# EasyEDA Pro project ProPrj_SensUs2026_ParisBioTek_PCBs.epro, schematic Schematic3
Board Name: NRF board; Create Date: 2026-04-29; Page Name: P1; Project Name: PBT_PCB; Schematic Name: Schematic3; Update Date: 2026-06-25; Company: EasyEDA.com; Page Size: A4; Version: V1.0
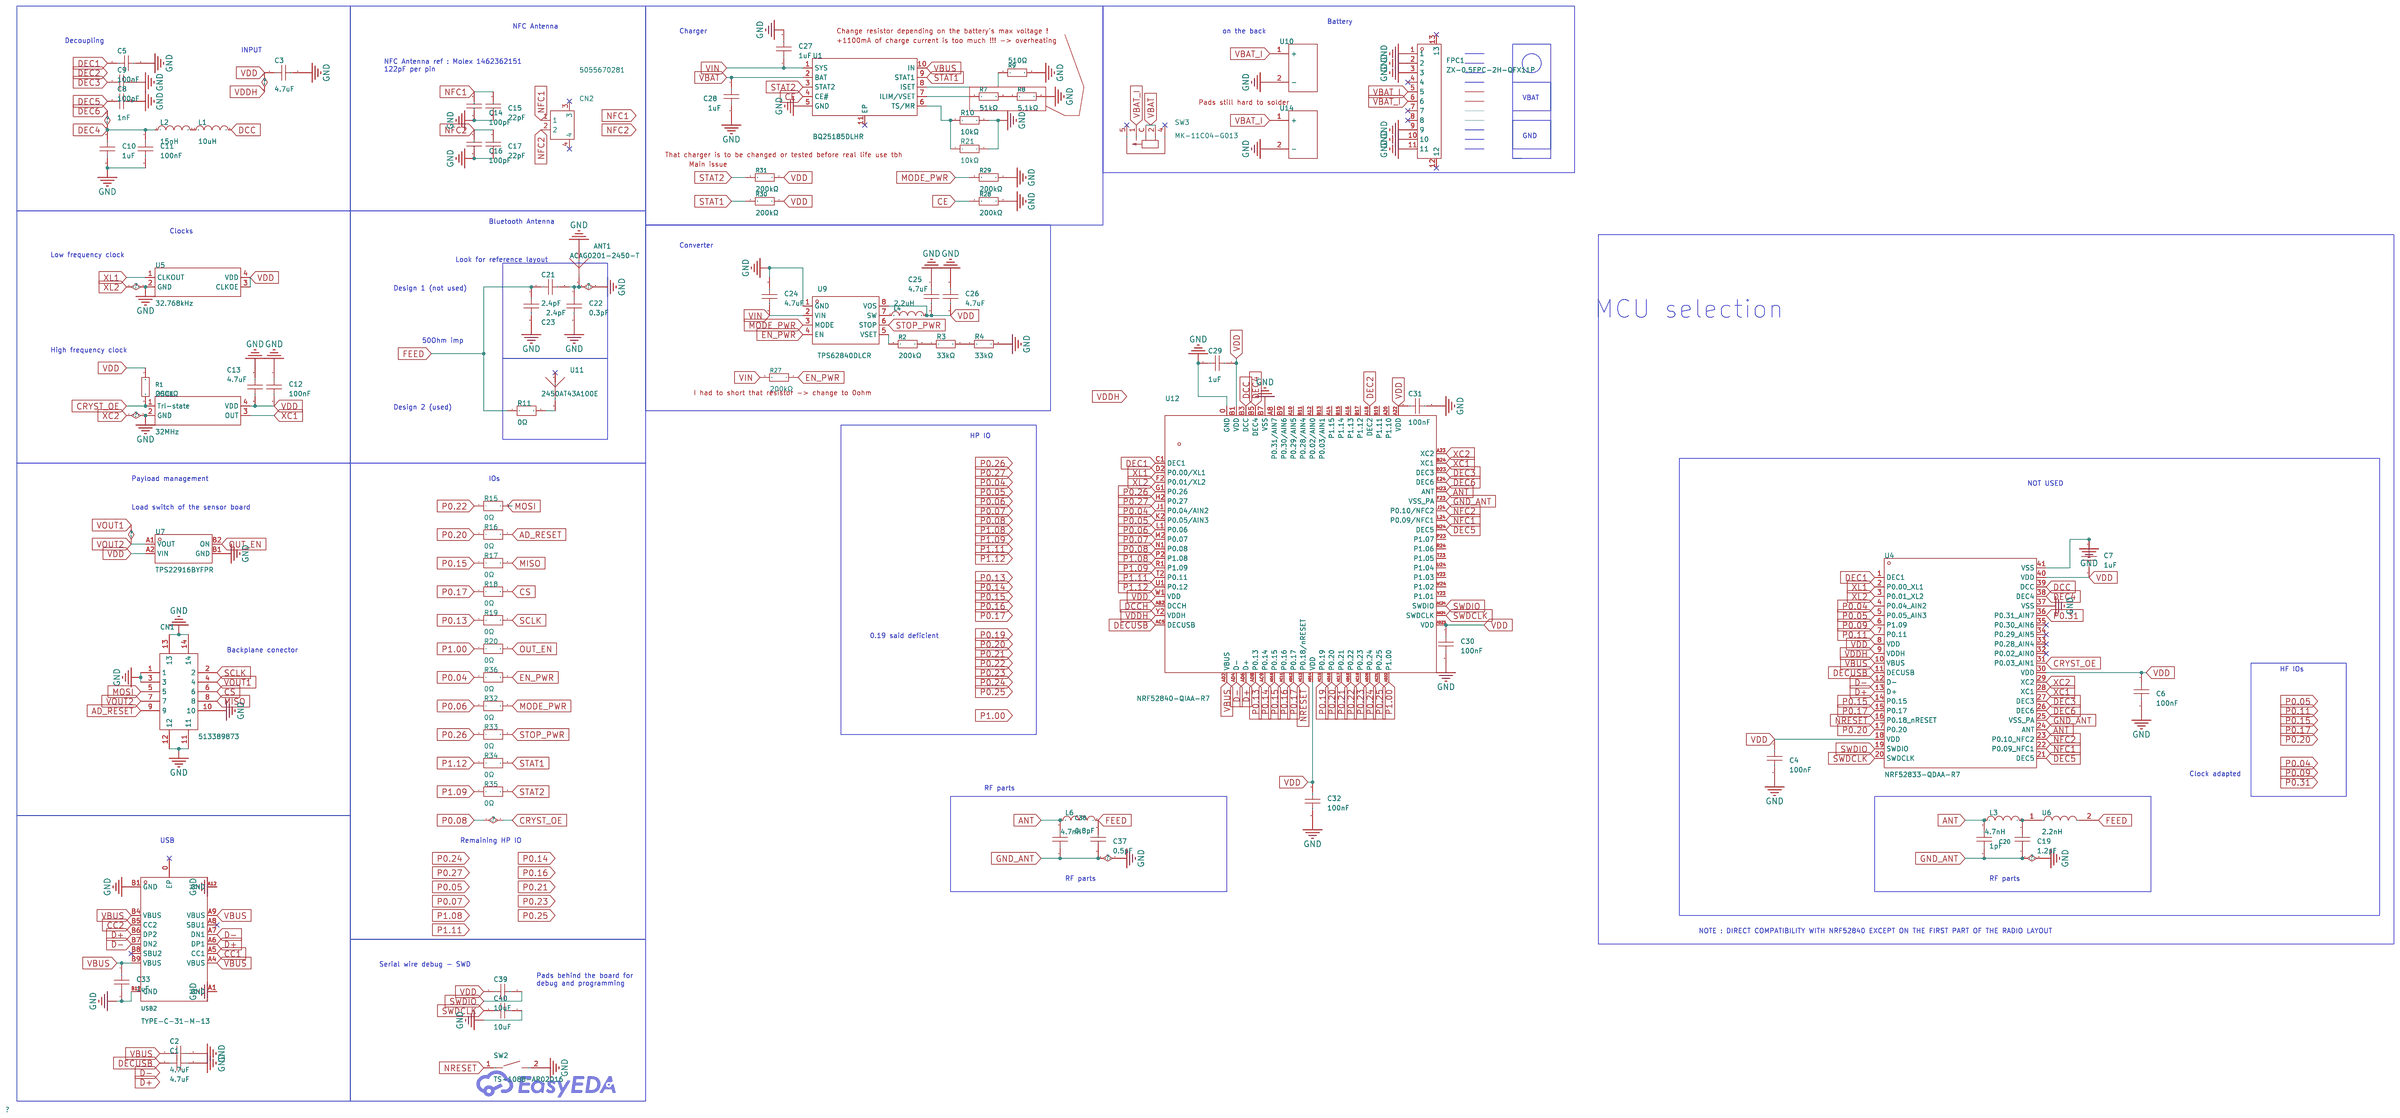
[diagram p1: schematic sheet]

## Parts
ANT1  ACAG0201-2450-T  [ANT-SMD_L2.0-W1.3_ACAG0201-2450-T]
C1  4.7uF  [C0402]
C2  4.7uF  [C0402]
C3  4.7uF  [C0402]
C4  100nF  [C0402]  (no BOM)
C5  100nF  [C0402]
C6  100nF  [C0402]  (no BOM)
C7  1uF  [C0402]  (no BOM)
C8  1nF  [C0402]
C9  100pF  [C0402]
C10  1uF  [C0402]
C11  100nF  [C0402]
C12  100nF  [C0402]
C13  4.7uF  [C0402]
C14  100pF  [C0402]
C15  22pF  [C0402]
C16  100pF  [C0402]
C17  22pF  [C0402]
C19  1.2pF  [C0402]  (no BOM)
C20  1pF  [C0402]  (no BOM)
C21  2.4pF  [C0402]
C22  0.3pF  [C0603]
C23  2.4pF  [C0402]  (no BOM)
C24  4.7uF  [C0402]
C25  4.7uF  [C0402]
C26  4.7uF  [C0402]
C27  1uF  [C0402]
C28  1uF  [C0402]
C29  1uF  [C0402]
C30  100nF  [C0402]
C31  100nF  [C0402]
C32  100nF  [C0402]
C33  1uF  [C0402]
C37  0.5pF  [C0402]
C38  0.8pF  [C0402]
C39  10uF  [C0805]  (no BOM)
C40  10uF  [C0805]  (no BOM)
CN1  513389873  [CONN-SMD_513389873]
CN2  5055670281  [CONN-SMD_2P-P1.25_MOLEX_5055670281]  (no BOM)
FPC1  ZX-0.5FPC-2H-QFX11P  [FPC-SMD_11P-P0.50_ZX-0.5FPC-2H-QFX11P]  (no BOM)
L1  10uH  [L0603]
L2  15nH  [IND-SMD_L1.2-W0.6]
L3  4.7nH  [L0402]  (no BOM)
L4  2.2uH  [IND-SMD_L2.0-W1.6_MHCHL201610A-1R0M-Q8A]
L6  4.7nH  [L0402]
OSC1  32MHz  [OSC-SMD_4P-L3.2-W2.5-BL]
R1  200kΩ  [R0402]
R2  200kΩ  [R0402]
R3  33kΩ  [R0402]
R4  33kΩ  [R0402]
R7  51kΩ  [R0402]
R8  5.1kΩ  [R0402]
R9  510Ω  [R0402]
R10  10kΩ  [R0402]
R11  0Ω  [R0402]
R15  0Ω  [R0402]
R16  0Ω  [R0402]
R17  0Ω  [R0402]
R18  0Ω  [R0402]
R19  0Ω  [R0402]
R20  0Ω  [R0402]
R21  10kΩ  [R0402]  (no BOM)
R27  200kΩ  [R0402]
R28  200kΩ  [R0402]
R29  200kΩ  [R0402]
R30  200kΩ  [R0402]
R31  200kΩ  [R0402]
R32  0Ω  [R0402]
R33  0Ω  [R0402]
R34  0Ω  [R0402]
R35  0Ω  [R0402]
R36  0Ω  [R0402]
SW2  TS-1088-AR02016  [SW-SMD_L3.9-W3.0-P4.45]
SW3  MK-11C04-G013  [SW-SMD_MK-11C04-G013]
U1  BQ25185DLHR  [WSON-10_L2.2-W2.0-P0.40-BL-EP_TI_DLH0010A]
U4  NRF52833-QDAA-R7  [QFN-40_L5.0-W5.0-P0.40-TL-EP3.6]  (no BOM)
U5  32.768kHz  [OSC-SMD_4P-L3.2-W1.5-BL]
U6  2.2nH  [L0402]  (no BOM)
U7  TPS22916BYFPR  [DSBGA-4_L0.8-W0.8-R2-C2-P0.40-BL]
U9  TPS62840DLCR  [VSON-8_L2.0-W1.5-P0.50-BL]
U10  -  [CSSMR950SH_CONN]
U11  2450AT43A100E  [ANT-SMD_L7.0-W2.0-R]
U12  NRF52840-QIAA-R7  [AQFN-73_L7.0-W7.0-P0.50-BL-EP4.8]
U14  -  [CSSMR950SH_CONN]
USB2  TYPE-C-31-M-13  [USB-C-SMD_TYPE-C-31-M-13]

## Library data of the parts
ANT1 = ACAG0201-2450-T: Antenna Type:Ceramic Antenna Frequency(Center/Band):2.4GHz Bandwidth:65MHz Peak Gain:2.7dBi Peak Gain:2.7dBi Impedance:50Ω VSWR:2 Operating Temperature:-40℃~+125℃ Operating Temperature:-40℃~+125℃ Length:2mm Width:1.25mm Height:0.6mm; LCSC Part Name: 低剖面紧凑型2.4 GHz陶瓷片式天线; Supplier Part: C3284598; Manufacturer: ABRACON; Supplier Footprint: 0805; Datasheet: https://item.szlcsc.com/datasheet/ACAG0201-2450-T/3847497.html; Supplier: LCSC; Antenna Type: Ceramic Antenna; Frequency(Center/Band): 2.4GHz; Bandwidth: 65MHz; Peak Gain: 2.7dBi; Impedance: 50Ω; VSWR: 2; Operating Temperature: -40℃~+125℃; Length: 2mm; Width: 1.25mm; Height: 0.6mm
C1-C3 C13 C24-C26 = CL05A475MP5NRNC: Capacitance:4.7uF Tolerance:±20% Tolerance:±20% Voltage Rating:10V Temperature Coefficient:X5R; LCSC Part Name: 4.7uF ±20% 10V; Supplier Part: C23733; Manufacturer: SAMSUNG(三星); Supplier Footprint: 0402; JLCPCB Part Class: Basic Part; Datasheet: https://item.szlcsc.com/datasheet/CL05A475MP5NRNC/24469.html; Supplier: LCSC; Tolerance: ±20%; Voltage Rating: 10V; Temperature Coefficient: X5R
C4-C6 C11 C12 C30-C32 = CL05B104KO5NNNC: Capacitance:100nF Tolerance:±10% Tolerance:±10% Voltage Rating:16V Temperature Coefficient:X7R; LCSC Part Name: 100nF ±10% 16V; Supplier Part: C1525; Manufacturer: SAMSUNG(三星); Supplier Footprint: 0402; JLCPCB Part Class: Basic Part; Datasheet: https://item.szlcsc.com/datasheet/CL05B104KO5NNNC/1877.html; Supplier: LCSC; Tolerance: ±10%; Voltage Rating: 16V; Temperature Coefficient: X7R
C7 C10 C27-C29 C33 = CL05A105KA5NQNC: Capacitance:1uF Tolerance:±10% Tolerance:±10% Voltage Rating:25V Temperature Coefficient:X5R; LCSC Part Name: 1uF ±10% 25V; Supplier Part: C52923; Manufacturer: SAMSUNG(三星); Supplier Footprint: 0402; JLCPCB Part Class: Basic Part; Datasheet: https://item.szlcsc.com/datasheet/CL05A105KA5NQNC/53938.html; Supplier: LCSC; Tolerance: ±10%; Voltage Rating: 25V; Temperature Coefficient: X5R
C8 = 0402B102K500NT: Capacitance:1nF Tolerance:±10% Tolerance:±10% Voltage Rating:50V Temperature Coefficient:X7R; LCSC Part Name: 1nF ±10% 50V; Supplier Part: C1523; Manufacturer: FH(风华); Supplier Footprint: 0402; Datasheet: https://item.szlcsc.com/datasheet/0402B102K500NT/1875.html; Supplier: LCSC; Tolerance: ±10%; Voltage Rating: 50V; Temperature Coefficient: X7R
C9 C14 C16 = 0402CG101J500NT: Capacitance: Tolerance:±5% Tolerance:±5% Voltage Rated: Temperature Coefficient:; LCSC Part Name: 100pF ±5% 50V; Supplier Part: C1546; Manufacturer: FH(风华); Supplier Footprint: 0402; JLCPCB Part Class: Basic Part; Datasheet: https://atta.szlcsc.com/upload/public/pdf/source/20200305/C486355_26A10D38EF8C2A5C37091D0039909270.pdf; Supplier: LCSC; Tolerance: ±5%
C15 C17 = 0402CG220J500NT: Capacitance:22pF Tolerance:±5% Tolerance:±5% Voltage Rating:50V Temperature Coefficient:C0G; LCSC Part Name: 22pF ±5% 50V; Supplier Part: C1555; Manufacturer: FH(风华); Supplier Footprint: 0402; Datasheet: https://item.szlcsc.com/datasheet/0402CG220J500NT/1907.html; Supplier: LCSC; Tolerance: ±5%; Voltage Rating: 50V; Temperature Coefficient: C0G
C19 = RF15N1R2A500CT: Capacitance: Voltage Rated: Temperature Coefficient:; LCSC Part Name: 1.2pF 50V; Supplier Part: C172868; Manufacturer: Walsin(华新科); Supplier Footprint: 0402; Datasheet: https://atta.szlcsc.com/upload/public/pdf/source/20191217/C469622_E5C675410661E206E30F3A5ADE7C582C.pdf; Supplier: LCSC
C20 = RF15N1R0A500CT: Capacitance:1pF Voltage Rating:50V Temperature Coefficient:NP0; LCSC Part Name: ±0.05pF 1pF 50V; Supplier Part: C172848; Manufacturer: Walsin(华新科); Supplier Footprint: 0402; Datasheet: https://item.szlcsc.com/datasheet/RF15N1R0A500CT/184237.html; Supplier: LCSC; Voltage Rating: 50V; Temperature Coefficient: NP0
C21 C23 = RF15N2R4A500CT: Capacitance: Voltage Rated: Temperature Coefficient:; LCSC Part Name: 2.4pF 50V ±0.05pF; Supplier Part: C396878; Manufacturer: Walsin(华新科); Supplier Footprint: 0402; JLCPCB Part Class: Extended Part; Datasheet: https://atta.szlcsc.com/upload/public/pdf/source/20191217/C469622_E5C675410661E206E30F3A5ADE7C582C.pdf; Supplier: LCSC
C22 = CQ0603ARNPO0BNR30: Capacitance:0.3pF Voltage Rating:100V Temperature Coefficient:NP0; LCSC Part Name: ±0.05pF 0.3pF 100V; Supplier Part: C386172; Manufacturer: YAGEO(国巨); Supplier Footprint: 0603; Datasheet: https://item.szlcsc.com/datasheet/CQ0603ARNPO0BNR30/360151.html; Supplier: LCSC; Voltage Rating: 100V; Temperature Coefficient: NP0
C37 = RF15N0R5A500CT: Capacitance: Voltage Rated: Temperature Coefficient:; LCSC Part Name: 0.5pF 50V ±0.05pF; Supplier Part: C172855; Manufacturer: Walsin(华新科); Supplier Footprint: 0402; Datasheet: https://atta.szlcsc.com/upload/public/pdf/source/20191217/C469622_E5C675410661E206E30F3A5ADE7C582C.pdf; Supplier: LCSC
C38 = RF15N0R8B500CT_C396870: Capacitance:0.8pF Voltage Rating:50V Temperature Coefficient:NP0; LCSC Part Name: ±0.1pF 0.8pF 50V; Supplier Part: C396870; Manufacturer: Walsin(华新科); Manufacturer Part: RF15N0R8B500CT; Supplier Footprint: 0402; Datasheet: https://item.szlcsc.com/datasheet/RF15N0R8B500CT/378314.html; Supplier: LCSC; Voltage Rating: 50V; Temperature Coefficient: NP0
C39 C40 = CL21A106KAYNNNE_C15850: Capacitance:10uF Tolerance:±10% Tolerance:±10% Voltage Rating:25V Temperature Coefficient:X5R; LCSC Part Name: 10uF ±10% 25V; Supplier Part: C15850; Manufacturer: SAMSUNG(三星); Manufacturer Part: CL21A106KAYNNNE; Supplier Footprint: 0805; Datasheet: https://item.szlcsc.com/datasheet/CL21A106KAYNNNE/16532.html; Supplier: LCSC; Tolerance: ±10%; Voltage Rating: 25V; Temperature Coefficient: X5R
CN1 = 513389873: Number of Pins:10P Pitch:0.4mm Mounting Type:Surface Mount,Vertical Number of Rows:2 Current Rating:300mA Voltage Rating:50V System Fit Height:2mm；1.5mm Contact Material:Phosphor Bronze Contact Plating:Gold Operating Temperature:-40℃~+105℃ Operating Tempe; LCSC Part Name: PIN:10P 间距:0.4mm 立贴; Supplier Part: C122427; Manufacturer: MOLEX; Supplier Footprint: SMD,P=0.4mm; JLCPCB Part Class: Extended Part; Datasheet: https://www.molex.com/content/dam/molex/molex-dot-com/products/automated/en-us/salesdrawingpdf/513/51338/513389873_sd.pdf?inline; Supplier: LCSC; Number of Pins: 10P; Pitch: 0.4mm; Mounting Type: Surface Mount,Vertical; Number of Rows: 2; Current Rating: 300mA; Voltage Rating: 50V; System Fit Height: 2mm；1.5mm; Contact Material: Phosphor Bronze; Contact Plating: Gold; Operating Temperature: -40℃~+105℃
CN2 = 5055670281: Pins Structure:1x2P Pitch:1.25mm Mounting Type:Surface Mount, Right Angle Number of Pins:2P Number of Rows:1 Number of PINs Per Row:2 Current Rating:1.5A Contact Material:Brass Contact Plating:Gold Operating Temperature:-40℃~+105℃ Operating Temperature:-4; LCSC Part Name: 1x2P 间距:1.25mm 卧贴; Supplier Part: C17256596; Manufacturer: MOLEX; Supplier Footprint: SMD,P=1.25mm; JLCPCB Part Class: Extended Part; Datasheet: https://www.molex.com/content/dam/molex/molex-dot-com/products/automated/en-us/salesdrawingpdf/505/505567/5055670281_sd.pdf?inline\; Supplier: LCSC; Pins Structure: 1x2P; Pitch: 1.25mm; Mounting Type: Surface Mount, Right Angle; Number of Pins: 2P; Number of Rows: 1; Number of PINs Per Row: 2; Current Rating: 1.5A; Contact Material: Brass; Contact Plating: Gold; Operating Temperature: -40℃~+105℃; Voltage Rating: 50V; Flame Retardant Rating: UL94V-0; Color: Black
FPC1 = ZX-0.5FPC-2H-QFX11P: Locking Feature:Hinged Lid Contact Type:Bottom Contact Number of Contacts:11P Pitch:0.5mm Mounting Type:Surface Mount, Right Angle FFC, FCB Thickness:0.3mm FFC, FCB Thickness:0.3mm Height Above Board:2mm Contact Material:Copper Alloy Contact Plating:Tin O; LCSC Part Name: 翻盖式 下接 P数:11P 间距:0.5mm; Supplier Part: C19191100; Manufacturer: Megastar(兆星); Supplier Footprint: SMD,P=0.5mm,卧贴; JLCPCB Part Class: Extended Part; Datasheet: https://item.szlcsc.com/datasheet/ZX-0.5FPC-2H-QFX11P/20428955.html; Supplier: LCSC; Locking Feature: Hinged Lid; Contact Type: Bottom Contact; Number of Contacts: 11P; Pitch: 0.5mm; Mounting Type: Surface Mount, Right Angle; FFC, FCB Thickness: 0.3mm; Height Above Board: 2mm; Contact Material: Copper Alloy; Contact Plating: Tin; Operating Temperature: -25℃~+85℃; Rated Voltage (Max): 50V
L1 = LQM18DN100M70L: Inductance: Tolerance:±20% Tolerance:±20% Rated Current:- Saturation Current (Isat): DC Resistance (DCR): Q @ Freq:- Frequency - Self Resonant:32MHz Ratings:; LCSC Part Name: 10uH ±20% 100mA; Supplier Part: C713281; Manufacturer: muRata(村田); Supplier Footprint: 0603; Datasheet: https://atta.szlcsc.com/upload/public/pdf/source/20210429/AB22F7ABB535E8E7DFFF970785F8131A.pdf; Supplier: LCSC; Tolerance: ±20%; Frequency - Self Resonant: 32MHz
L2 = AISC-0402-15NJ-T: Inductance:15nH Tolerance:±5% Tolerance:±5% Current Rating:560mA Current - Saturation (Isat):- DC Resistance(DCR):- Q @ Frequency:26@250MHz Frequency - Self Resonant:3.28GHz; LCSC Part Name: 15nH ±5%; Supplier Part: C186832; Manufacturer: ABRACON; Supplier Footprint: 0402; Datasheet: https://item.szlcsc.com/datasheet/AISC-0402-15NJ-T/198237.html; Supplier: LCSC; Tolerance: ±5%; Current Rating: 560mA; Q @ Frequency: 26@250MHz; Frequency - Self Resonant: 3.28GHz
L3 L6 = VHF100505HQ4N7ST: Inductance:4.7nH Current Rating:300mA Current - Saturation (Isat):- DC Resistance(DCR):200mΩ Q @ Frequency:- Frequency - Self Resonant:- Ratings:-; LCSC Part Name: ±0.3nH 4.7nH; Supplier Part: C395070; Manufacturer: FH(风华); Supplier Footprint: 0402; Datasheet: https://item.szlcsc.com/datasheet/VHF100505HQ4N7ST/375486.html; Supplier: LCSC; Current Rating: 300mA; DC Resistance(DCR): 200mΩ
L4 = WIP201610P-2R2ML: Inductance: Tolerance:±20% Tolerance:±20% Rated Current: Saturation Current (Isat):- DC Resistance (DCR): Q @ Freq:- Frequency - Self Resonant:- Ratings:; LCSC Part Name: 2.2uH ±20%; Supplier Part: C315717; Manufacturer: INPAQ(佳邦); Supplier Footprint: 0806; Datasheet: https://atta.szlcsc.com/upload/public/pdf/source/20181022/C315716_08E9DB17D82CB1F96C1ECEC7E5AE09CA.pdf; Supplier: LCSC; Tolerance: ±20%
OSC1 = OT2EL89CJI-111YLC-32M: Frequency:32MHz Normal temperature Frequency Tolerance:±10ppm Normal temperature Frequency Tolerance:±10ppm Output Type:CMOS Voltage - Supply:1.8V~3.3V Voltage - Supply:1.8V~3.3V Frequency Stability:±20ppm Frequency Stability:±20ppm Operating Temperature:; LCSC Part Name: YSO110TR 32MHZ 1.8V-3.3V ±10PPM -40~85℃（±20PPM) CMOS; Supplier Part: C7434927; Manufacturer: YXC(扬兴晶振); Supplier Footprint: SMD3225-4P; Datasheet: https://item.szlcsc.com/datasheet/OT2EL89CJI-111YLC-32M/8448260.html; Supplier: LCSC; Normal temperature Frequency Tolerance: ±10ppm; Output Type: CMOS; Voltage - Supply: 1.8V~3.3V; Frequency Stability: ±20ppm; Operating Temperature: -40℃~+85℃
R1 R2 R27-R31 = 0402WGF2003TCE: Type:Thick Film Resistor Resistance:200kΩ Tolerance:±1% Tolerance:±1% Power(Watts):62.5mW Voltage-Supply(Max):50V Temperature Coefficient:±100ppm/℃ Temperature Coefficient:±100ppm/℃ Operating Temperature:-55℃~+155℃ Operating Temperature:-55℃~+155℃; LCSC Part Name: 200kΩ ±1% 62.5mW 厚膜电阻; Supplier Part: C25764; Manufacturer: UNI-ROYAL(厚声); Supplier Footprint: 0402; Datasheet: https://item.szlcsc.com/datasheet/0402WGF2003TCE/26507.html; Supplier: LCSC; Type: Thick Film Resistor; Tolerance: ±1%; Power(Watts): 62.5mW; Voltage-Supply(Max): 50V; Temperature Coefficient: ±100ppm/℃; Operating Temperature: -55℃~+155℃
R3 R4 = 0402WGF3302TCE: Type:Thick Film Resistors Resistance:33kΩ Tolerance:±1% Tolerance:±1% Power(Watts): Overload Voltage (Max): Temperature Coefficient:±100ppm/℃ Temperature Coefficient:±100ppm/℃ Operating Temperature Range:-55℃~+155℃ Operating Temperature Range:-55℃~+155℃; LCSC Part Name: 33kΩ ±1% 62.5mW 厚膜电阻; Supplier Part: C25779; Manufacturer: UNI-ROYAL(厚声); Supplier Footprint: 0402; JLCPCB Part Class: Basic Part; Datasheet: https://atta.szlcsc.com/upload/public/pdf/source/20200306/C422600_1E6D84923E4A46A82E41ADD87F860B5C.pdf; Supplier: LCSC; Type: Thick Film Resistors; Tolerance: ±1%; Temperature Coefficient: ±100ppm/℃; Operating Temperature Range: -55℃~+155℃
R7 = 0402WGF5102TCE: Type:Thick Film Resistors Resistance:51kΩ Tolerance:±1% Tolerance:±1% Power(Watts): Overload Voltage (Max): Temperature Coefficient:±100ppm/℃ Temperature Coefficient:±100ppm/℃ Operating Temperature Range:-55℃~+155℃ Operating Temperature Range:-55℃~+155℃; LCSC Part Name: 51kΩ ±1% 62.5mW 厚膜电阻; Supplier Part: C25794; Manufacturer: UNI-ROYAL(厚声); Supplier Footprint: 0402; Datasheet: https://atta.szlcsc.com/upload/public/pdf/source/20200306/C422600_1E6D84923E4A46A82E41ADD87F860B5C.pdf; Supplier: LCSC; Type: Thick Film Resistors; Tolerance: ±1%; Temperature Coefficient: ±100ppm/℃; Operating Temperature Range: -55℃~+155℃
R8 = 0402WGF5101TCE: Type:Thick Film Resistor Resistance:5.1kΩ Tolerance:±1% Tolerance:±1% Power(Watts):62.5mW Voltage-Supply(Max):50V Temperature Coefficient:±100ppm/℃ Temperature Coefficient:±100ppm/℃ Operating Temperature:-55℃~+155℃ Operating Temperature:-55℃~+155℃; LCSC Part Name: 5.1kΩ ±1% 62.5mW 厚膜电阻; Supplier Part: C25905; Manufacturer: UNI-ROYAL(厚声); Supplier Footprint: 0402; Datasheet: https://item.szlcsc.com/datasheet/0402WGF5101TCE/26648.html; Supplier: LCSC; Type: Thick Film Resistor; Tolerance: ±1%; Power(Watts): 62.5mW; Voltage-Supply(Max): 50V; Temperature Coefficient: ±100ppm/℃; Operating Temperature: -55℃~+155℃
R9 = 0402WGF5100TCE: Type:Thick Film Resistor Resistance:510Ω Tolerance:±1% Tolerance:±1% Power(Watts):62.5mW Voltage-Supply(Max):50V Temperature Coefficient:±100ppm/℃ Temperature Coefficient:±100ppm/℃ Operating Temperature:-55℃~+155℃ Operating Temperature:-55℃~+155℃; LCSC Part Name: 510Ω ±1% 62.5mW 厚膜电阻; Supplier Part: C25123; Manufacturer: UNI-ROYAL(厚声); Supplier Footprint: 0402; Datasheet: https://item.szlcsc.com/datasheet/0402WGF5100TCE/25866.html; Supplier: LCSC; Type: Thick Film Resistor; Tolerance: ±1%; Power(Watts): 62.5mW; Voltage-Supply(Max): 50V; Temperature Coefficient: ±100ppm/℃; Operating Temperature: -55℃~+155℃
R10 R21 = 0402WGF1002TCE: Type:Thick Film Resistor Resistance:10kΩ Tolerance:±1% Tolerance:±1% Power(Watts):62.5mW Voltage-Supply(Max):50V Temperature Coefficient:±100ppm/℃ Temperature Coefficient:±100ppm/℃ Operating Temperature:-55℃~+155℃ Operating Temperature:-55℃~+155℃; LCSC Part Name: 10kΩ ±1% 62.5mW 厚膜电阻; Supplier Part: C25744; Manufacturer: UNI-ROYAL(厚声); Supplier Footprint: 0402; JLCPCB Part Class: Basic Part; Datasheet: https://item.szlcsc.com/datasheet/0402WGF1002TCE/26487.html; Supplier: LCSC; Type: Thick Film Resistor; Tolerance: ±1%; Power(Watts): 62.5mW; Voltage-Supply(Max): 50V; Temperature Coefficient: ±100ppm/℃; Operating Temperature: -55℃~+155℃
R11 R15-R20 R32-R36 = CRCW04020000Z0EDHP: Type:Thick Film Resistor Resistance:0Ω Power(Watts):200mW Voltage-Supply(Max):50V Operating Temperature:-55℃~+155℃ Operating Temperature:-55℃~+155℃; LCSC Part Name: 厚膜电阻 0Ω; Supplier Part: C844711; Manufacturer: VISHAY(威世); Supplier Footprint: 0402; Datasheet: https://item.szlcsc.com/datasheet/CRCW04020000Z0EDHP/904285.html; Supplier: LCSC; Type: Thick Film Resistor; Power(Watts): 200mW; Voltage-Supply(Max): 50V; Operating Temperature: -55℃~+155℃
SW2 = TS-1088-AR02016: Circuit:SPST Actuator Style:Round Button Operating Force:1.6N Mounting Type:Surface Mount,Vertical Length:4mm Width:3mm Switch Height:2mm with Bracket:Without Bracket Contact Current:50mA Voltage Rating:12V Actuator/Cap Color:Black Termination Style:SMD(S; LCSC Part Name: 4*3*2mm 立贴 轻触开关; Supplier Part: C720477; Manufacturer: XUNPU(讯普); Supplier Footprint: SMD,4x3mm; JLCPCB Part Class: Basic Part; Datasheet: https://item.szlcsc.com/datasheet/TS-1088-AR02016/763484.html; Supplier: LCSC; Circuit: SPST; Actuator Style: Round Button; Operating Force: 1.6N; Mounting Type: Surface Mount,Vertical; Length: 4mm; Width: 3mm; Switch Height: 2mm; with Bracket: Without Bracket; Contact Current: 50mA; Voltage Rating: 12V; Actuator/Cap Color: Black; Termination Style: SMD(SMT) Tab; Life: 100,000 Cycles; Operating Temperature: -30℃~+80℃
SW3 = MK-11C04-G013: Circuit:SPDT Actuator Style:Rectangular Columnar Termination Style:J-Lead Length:5.5mm Width:0.7mm Switch Height:3.8mm Mounting Type:Surface Mount, Right Angle Actuator Color:Black Current Rating:1A Voltage Rating:6V Life:10,000 Cycles Operating Temperatu; LCSC Part Name: 1P2T超小型拨动开关; Supplier Part: C778185; Manufacturer: G-Switch(品赞); Supplier Footprint: SMD,5.5x0.7mm; JLCPCB Part Class: Extended Part; Datasheet: https://item.szlcsc.com/datasheet/MK-11C04-G013/826786.html; Supplier: LCSC; Circuit: SPDT; Actuator Style: Rectangular Columnar; Termination Style: J-Lead; Length: 5.5mm; Width: 0.7mm; Switch Height: 3.8mm; Mounting Type: Surface Mount, Right Angle; Actuator Color: Black; Current Rating: 1A; Voltage Rating: 6V; Life: 10,000 Cycles; Operating Temperature: -20℃~+70℃
U1 = BQ25185DLHR: The Chip Type:Charging IC Voltage - Supply:3V~18V Voltage - Supply:3V~18V Charge Current - Max:1A Charging Saturation Voltage:4.4V End-Off Voltage:2.2V Type of Battery:Lithium Battery；LiFePO4 Battery Number of Cells:1 Number of Cells:1 Operating Temperatu; LCSC Part Name: 单节1A独立线性电池充电器，具备电源路径、工厂模式和电池跟踪功能; Supplier Part: C19725033; Manufacturer: TI(德州仪器); Supplier Footprint: WSON-10-EP(2.2x2); JLCPCB Part Class: Extended Part; Datasheet: https://www.ti.com.cn/cn/lit/ds/symlink/bq25185.pdf?ts=1739415017761&ref_url=https%253A%252F%252Fwww.ti.com.cn%252Fproduct%252Fcn%252FBQ25185%253FkeyMatch%253Dbq25185%2526tisearch%253Duniversal_search; Supplier: LCSC; The Chip Type: Charging IC; Voltage - Supply: 3V~18V; Charge Current - Max: 1A; Charging Saturation Voltage: 4.4V; End-Off Voltage: 2.2V; Type of Battery: Lithium Battery；LiFePO4 Battery; Number of Cells: 1; Operating Temperature: -40℃~+125℃; Battery Temperature Detection: Support; Supply Current (Iq): 4uA
U4 = NRF52833-QDAA-R7: Frequency Range:2.4GHz~2.4835GHz Frequency Range:2.4GHz~2.4835GHz Interface:ADC；PWM；I2S；UART；USB；SPI Voltage - Supply:1.7V~5.5V Voltage - Supply:1.7V~5.5V Applications:Bluetooth；ISM；IoT Output Power:8dBm Data Rate:2Mbps Current Of Transmitting:- Sensitivi; Supplier Part: C3007767; Manufacturer: NORDIC; Supplier Footprint: QFN-40-EP(5x5); Datasheet: https://item.szlcsc.com/datasheet/NRF52833-QDAA-R7/3496813.html; Supplier: LCSC; Frequency Range: 2.4GHz~2.4835GHz; Interface: ADC；PWM；I2S；UART；USB；SPI; Voltage - Supply: 1.7V~5.5V; Applications: Bluetooth；ISM；IoT; Output Power: 8dBm; Data Rate: 2Mbps; Typical Application Frequency: 2.4GHz; Operating Temperature: -40℃~+105℃
U5 = OV-7604-C7-32.768kHz-20PPM-TA-QC: Frequency:32.768kHz Normal temperature Frequency Tolerance:±20ppm Normal temperature Frequency Tolerance:±20ppm Operating Temperature:-40℃~+85℃ Operating Temperature:-40℃~+85℃; LCSC Part Name: 32.768kHz ±20ppm; Supplier Part: C5337982; Manufacturer: Micro Crystal(瑞士微晶); Supplier Footprint: SMD3215-4P; JLCPCB Part Class: Extended Part; Datasheet: https://www.microcrystal.com/fileadmin/Media/Products/kHzOSC/Datasheet/OV-7604-C7.pdf; Supplier: LCSC; Normal temperature Frequency Tolerance: ±20ppm; Operating Temperature: -40℃~+85℃
U6 = VHF100505HQ2N2BT: Inductance:; Supplier Part: C3032804; Manufacturer: FH(风华); Supplier Footprint: 0402; JLCPCB Part Class: Extended Part; Datasheet: https://atta.szlcsc.com/upload/public/pdf/source/20230208/097A5FD33363C9318A1C8B9447979AC6.pdf; Supplier: LCSC
U7 = TPS22916BYFPR: Type:Load Switch Number of Channels:1 Control Input Logic:Active High Voltage - Supply:1V~5.5V Voltage - Supply:1V~5.5V RDS(on):60mΩ Operating Temperature-:-40℃~+85℃ Operating Temperature-:-40℃~+85℃; LCSC Part Name: 1V至5.5V、2A、60mΩ超低泄漏负载开关; Supplier Part: C2150095; Manufacturer: TI(德州仪器); Supplier Footprint: DSBGA-4(0.7x0.7); Datasheet: https://www.ti.com/cn/lit/gpn/tps22916; Supplier: LCSC; Type: Load Switch; Number of Channels: 1; Control Input Logic: Active High; Voltage - Supply: 1V~5.5V; RDS(on): 60mΩ; Operating Temperature	-: -40℃~+85℃
U9 = TPS62840DLCR: Function:Buck Voltage - Supply:1.8V~6.5V Voltage - Supply:1.8V~6.5V Output Voltage:1.8V~3.3V Output Voltage:1.8V~3.3V Output Current:750mA Frequency - Switching:1.8MHz Frequency - Switching:1.8MHz Operating Temperature:-40℃~+125℃@(TJ) Operating Temperatur; LCSC Part Name: 1.8V至6.5V、750mA、60nA IQ降压转换器; Supplier Part: C2071859; Manufacturer: TI(德州仪器); Supplier Footprint: VSON-8(1.5x2); JLCPCB Part Class: Extended Part; Datasheet: https://www.ti.com/cn/lit/gpn/tps62840; Supplier: LCSC; Function: Buck; Voltage - Supply: 1.8V~6.5V; Output Voltage: 1.8V~3.3V; Output Current: 750mA; Frequency - Switching: 1.8MHz; Operating Temperature: -40℃~+125℃@(TJ); Synchronous Rectifier: Yes; Number of Outputs: 1; Topology: Buck; Quiescent Current: 60nA; Switch tube (built-in/external): Built-in; Output Type: Adjustable
U10 U14 = CSSMR950SH_CONN: Pad to solder the connector of a CSSMR950SH lipo battery.
U11 = 2450AT43A100E: Antenna Type:2.4G Antenna Frequency(Center/Band):2.4GHz Peak Gain:2dBi Peak Gain:2dBi Impedance:50Ω Power:2W VSWR:1.5 Operating Temperature:-40℃~+85℃ Operating Temperature:-40℃~+85℃; LCSC Part Name: 2.45GHz SMD陶瓷芯片天线; Supplier Part: C2917720; Manufacturer: JOHANSON(约翰逊); Supplier Footprint: SMD,7x2mm; Datasheet: https://item.szlcsc.com/datasheet/2450AT43A100E/3217912.html; Supplier: LCSC; Antenna Type: 2.4G Antenna; Frequency(Center/Band): 2.4GHz; Peak Gain: 2dBi; Impedance: 50Ω; Power: 2W; VSWR: 1.5; Operating Temperature: -40℃~+85℃
U12 = NRF52840-QIAA-R7: Frequency Range:2.4GHz~2.4835GHz Frequency Range:2.4GHz~2.4835GHz Interface:I2S；SPI；PDM；USB；PWM；UART Voltage - Supply:1.7V~5.5V Voltage - Supply:1.7V~5.5V Applications:ZigBee；Bluetooth Output Power:8dBm Data Rate:2Mbps Current Of Transmitting:4.82mA Sensi; LCSC Part Name: 具备灵活电源管理和丰富接口的2.4 GHz收发器; Supplier Part: C1851953; Manufacturer: NORDIC; Supplier Footprint: AQFN-73-EP(7x7); JLCPCB Part Class: Extended Part; Datasheet: https://item.szlcsc.com/datasheet/NRF52840-QIAA-R7/1942766.html; Supplier: LCSC; Frequency Range: 2.4GHz~2.4835GHz; Interface: I2S；SPI；PDM；USB；PWM；UART; Voltage - Supply: 1.7V~5.5V; Applications: ZigBee；Bluetooth; Output Power: 8dBm; Data Rate: 2Mbps; Current Of Transmitting: 4.82mA; Sensitivity: -95dBm; Receive Current: 6.26mA; Typical Application Frequency: 2.4GHz; Type: transceiver
USB2 = TYPE-C-31-M-13: Connector Type:Type-C Protocol Standard:- Gender:Female Mounting Type:Laminated board Number of Contacts:12P Number of Ports:1 Current Rating-Power:3A Voltage Rating:100V Connect-Disconnect Life:10,000 cycles Length:6.5mm Detection color:Black Operating T; LCSC Part Name: Type-C 母 沉板; Supplier Part: C223906; Manufacturer: 韩国韩荣; Supplier Footprint: SMD; JLCPCB Part Class: Extended Part; Datasheet: https://item.szlcsc.com/datasheet/TYPE-C-31-M-13/224051.html; Supplier: LCSC; Connector Type: Type-C; Gender: Female; Mounting Type: Laminated board; Number of Contacts: 12P; Number of Ports: 1; Current Rating-Power: 3A; Voltage Rating: 100V; Connect-Disconnect Life: 10,000 cycles; Length: 6.5mm; Detection color: Black; Operating Temperature: -30℃~+85℃

## Nets
GND: ANT1.1 ANT1.2 C1.2 C2.2 C3.2 C4.2 C5.2 C6.2 C7.1 C8.2 C9.2 C10.1 C11.2 C12.1 C13.1 C14.2 C15.2 C16.2 C17.2 C19.2 C20.1 C21.2 C22.1 C22.2 C23.2 C24.1 C25.1 C26.1 C27.2 C28.2 C29.2 C30.2 C31.2 C32.2 C33.2 C37.2 C38.1 C40.1 CN1.1 CN1.3 CN1.10 CN1.11 CN1.12 CN1.13 CN1.14 FPC1.1 FPC1.2 FPC1.3 FPC1.9 FPC1.10 FPC1.11 OSC1.2(GND) R4.2 R8.2 R9.2 R10.2 R21.2 R28.2 R29.1 SW2.2 U1.5(GND) U4.3(P0.01_XL2) U4.25(VSS_PA) U4.29(XC2) U4.37(VSS) U4.41(VSS) U5.2(GND) U7.B1(GND) U9.1(GND) U10.2(-) U12.0(GND) U12.A23(XC2) U12.B7(VSS) U12.F2(P0.01/XL2) U12.F23(VSS_PA) U14.2(-) USB2.A1(GND) USB2.A12(GND) USB2.B1(GND) USB2.B12(GND)
VBAT: C28.1 SW3.2 SW3.C U1.2(BAT)
VBAT_I: FPC1.5 FPC1.6 SW3.1 U10.1(+) U14.1(+)
VBUS: C2.1 C33.1 U1.10(IN) U4.10(VBUS) U12.AD2(VBUS) USB2.A4(VBUS) USB2.A9(VBUS) USB2.B4(VBUS) USB2.B9(VBUS)
VDD: C3.1 C4.1 C6.1 C7.2 C12.2 C13.2 C25.2 C26.2 C29.1 C30.1 C31.1 C32.1 C39.1 L4.2 OSC1.4(VDD) R1.1 R30.1 R31.1 U4.8(VDD) U4.9(VDDH) U4.18(VDD) U4.30(VDD) U4.40(VDD) U5.3(CLKOE) U5.4(VDD) U7.A2(VIN) U9.8(VOS) U12.A22(VDD) U12.AD14(VDD) U12.AD23(VDD) U12.B1(VDD) U12.W1(VDD) U12.Y2(VDDH)
VIN: C24.2 C27.1 R27.2 U1.1(SYS) U9.2(VIN)
AD_RESET: CN1.9 R16.2
ANT: C20.2 C38.2 L3.1 L6.1 U4.24(ANT) U12.H23(ANT)
CC1: USB2.A5(CC1)
CC2: USB2.B5(CC2)
CE: R28.1 U1.4(CE#)
CRYST_OE: OSC1.1(Tri-state) R1.2 U4.31(P0.03_AIN1) U12.N1(P0.08)
CS: CN1.6 R18.2
D+: U4.13(D+) U12.AD6(D+) USB2.A6(DP1) USB2.B6(DP2)
D-: U4.12(D-) U12.AD4(D-) USB2.A7(DN1) USB2.B7(DN2)
DCC: L1.2 U4.39(DCC) U12.B3(DCC)
DCCH: U12.AB2(DCCH)
DEC1: C5.1 U4.1(DEC1) U12.C1(DEC1)
DEC2: U12.A18(DEC2)
DEC3: C9.1 U4.27(DEC3) U12.D23(DEC3)
DEC4: C10.2 C11.1 L2.1 U4.26(DEC6) U4.38(DEC4) U12.B5(DEC4) U12.E24(DEC6)
DEC5: C8.1 U4.21(DEC5) U12.N24(DEC5)
DECUSB: C1.1 U4.11(DECUSB) U12.AC5(DECUSB)
EN_PWR: R27.1 R36.2 U9.4(EN)
FEED: C21.1 C23.1 C37.1 L6.2 R11.1 U6.2
MISO: CN1.8 R17.2
MODE_PWR: R29.2 R32.2 U9.3(MODE)
MOSI: CN1.5 R15.2
NFC1: C14.1 C15.1 CN2.1 U4.22(P0.09_NFC1) U12.L24(P0.09/NFC1)
NFC2: C16.1 C17.1 CN2.2 U4.23(P0.10_NFC2) U12.J24(P0.10/NFC2)
NRESET: SW2.1 U4.16(P0.18_nRESET) U12.AC13(P0.18/nRESET)
OUT_EN: R20.2 U7.B2(ON)
P0.04: R36.1 U4.4(P0.04_AIN2) U12.J1(P0.04/AIN2)
P0.05: U4.5(P0.05_AIN3) U12.K2(P0.05/AIN3)
P0.06: R32.1 U12.L1(P0.06)
P0.07: U12.M2(P0.07)
P0.09: U4.6(P1.09)
P0.11: U4.7(P0.11)
P0.13: R19.1 U12.AD8(P0.13)
P0.14: U12.AC9(P0.14)
P0.15: R17.1 U4.14(P0.15) U12.AD10(P0.15)
P0.16: U12.AC11(P0.16)
P0.17: R18.1 U4.15(P0.17) U12.AD12(P0.17)
P0.19: U12.AC15(P0.19)
P0.20: R16.1 U4.17(P0.20) U12.AD16(P0.20)
P0.21: U12.AC17(P0.21)
P0.22: R15.1 U12.AD18(P0.22)
P0.23: U12.AC19(P0.23)
P0.24: U12.AD20(P0.24)
P0.25: U12.AC21(P0.25)
P0.26: R33.1 U12.G1(P0.26)
P0.27: U12.H2(P0.27)
P0.31: U4.36(P0.31_AIN7)
P1.00: R20.1 U12.AD22(P1.00)
P1.08: U12.P2(P1.08)
P1.09: R35.1 U12.R1(P1.09)
P1.11: U12.T2(P0.11)
P1.12: R34.1 U12.U1(P0.12)
SCLK: CN1.2 R19.2
STAT1: R30.2 R34.2 U1.9(STAT1)
STAT2: R31.2 R35.2 U1.3(STAT2)
STOP_PWR: R33.2 U9.6(STOP)
SWDCLK: C40.2 U4.20(SWDCLK) U12.AA24(SWDCLK)
SWDIO: C39.2 U4.19(SWDIO) U12.AC24(SWDIO)
VOUT1: CN1.4 CN1.7 U7.A1(VOUT)
XC1: OSC1.3(OUT) U4.28(XC1) U12.B24(XC1)
XL1: U4.2(P0.00_XL1) U5.1(CLKOUT) U12.D2(P0.00/XL1)
$1N3350: L1.1 L2.2
$1N6090: R2.1 U9.5(VSET)
$1N6166: R2.2 R3.1
$1N6242: R3.2 R4.1
$1N6296: L4.1 U9.7(SW)
$1N6953: R7.1 U1.7(ILIM/VSET)
$1N7034: R7.2 R8.1
$1N7110: R9.1 U1.8(ISET)
$1N7200: R10.1 R21.1 U1.6(TS/MR)
$1N13722: R11.2 U11.1(ANT)
Net-(C19-1): C19.1 L3.2 U6.1

Not connected (* = marked no-connect by the designer): CN2 3* 4*; FPC1 4* 7* 8* 12* 13*; SW3 4* 5*; U1 11(EP)*; U4 32(P0.02_AIN0)* 33(P0.28_AIN4)* 34(P0.29_AIN5)* 35(P0.30_AIN6)*; U11 2*; U12 A8(P0.31/AIN7) A10(P0.29/AIN5) A12(P0.02/AIN0) A14(P1.15) A16(P1.13) A20(P1.10) B9(P0.30/AIN6) B11(P0.28/AIN4) B13(P0.03/AIN1) B15(P1.14) B17(P1.12) B19(P1.11) P23(P1.07) R24(P1.06) T23(P1.05) U24(P1.04) V23(P1.03) W24(P1.02) Y23(P1.01); USB2 0(EP)* A8(SBU1)* B8(SBU2)*

## Notes on the sheet
- NFC Antenna
- Battery
- Decoupling
- Charger
- +1100mA of charge current is too much !!! -> overheating
- Change resistor depending on the battery's max voltage !
- on the back
- INPUT
- NFC Antenna ref : Molex 1462362151
  122pF per pin
- VBAT
- Pads still hard to solder
- GND
- That charger is to be changed or tested before real life use tbh
- Main issue
- Bluetooth Antenna
- Clocks
- Low frequency clock
- Converter
- Look for reference layout
- Design 1 (not used)
- MCU selection
- 50Ohm imp
- High frequency clock
- I had to short that resistor -> change to 0ohm
- Design 2 (used)
- HP IO
- Payload management
- IOs
- NOT USED
- Load switch of the sensor board
- 0.19 said deficient
- Backplane conector
- HF IOs
- Clock adapted
- RF parts
- USB
- Remaining HP IO
- RF parts
- RF parts
- NOTE : DIRECT COMPATIBILITY WITH NRF52840 EXCEPT ON THE FIRST PART OF THE RADIO LAYOUT
- Serial wire debug - SWD
- Pads behind the board for
  debug and programming
